# Altium schematic sheet MCU.SchDoc
size A3
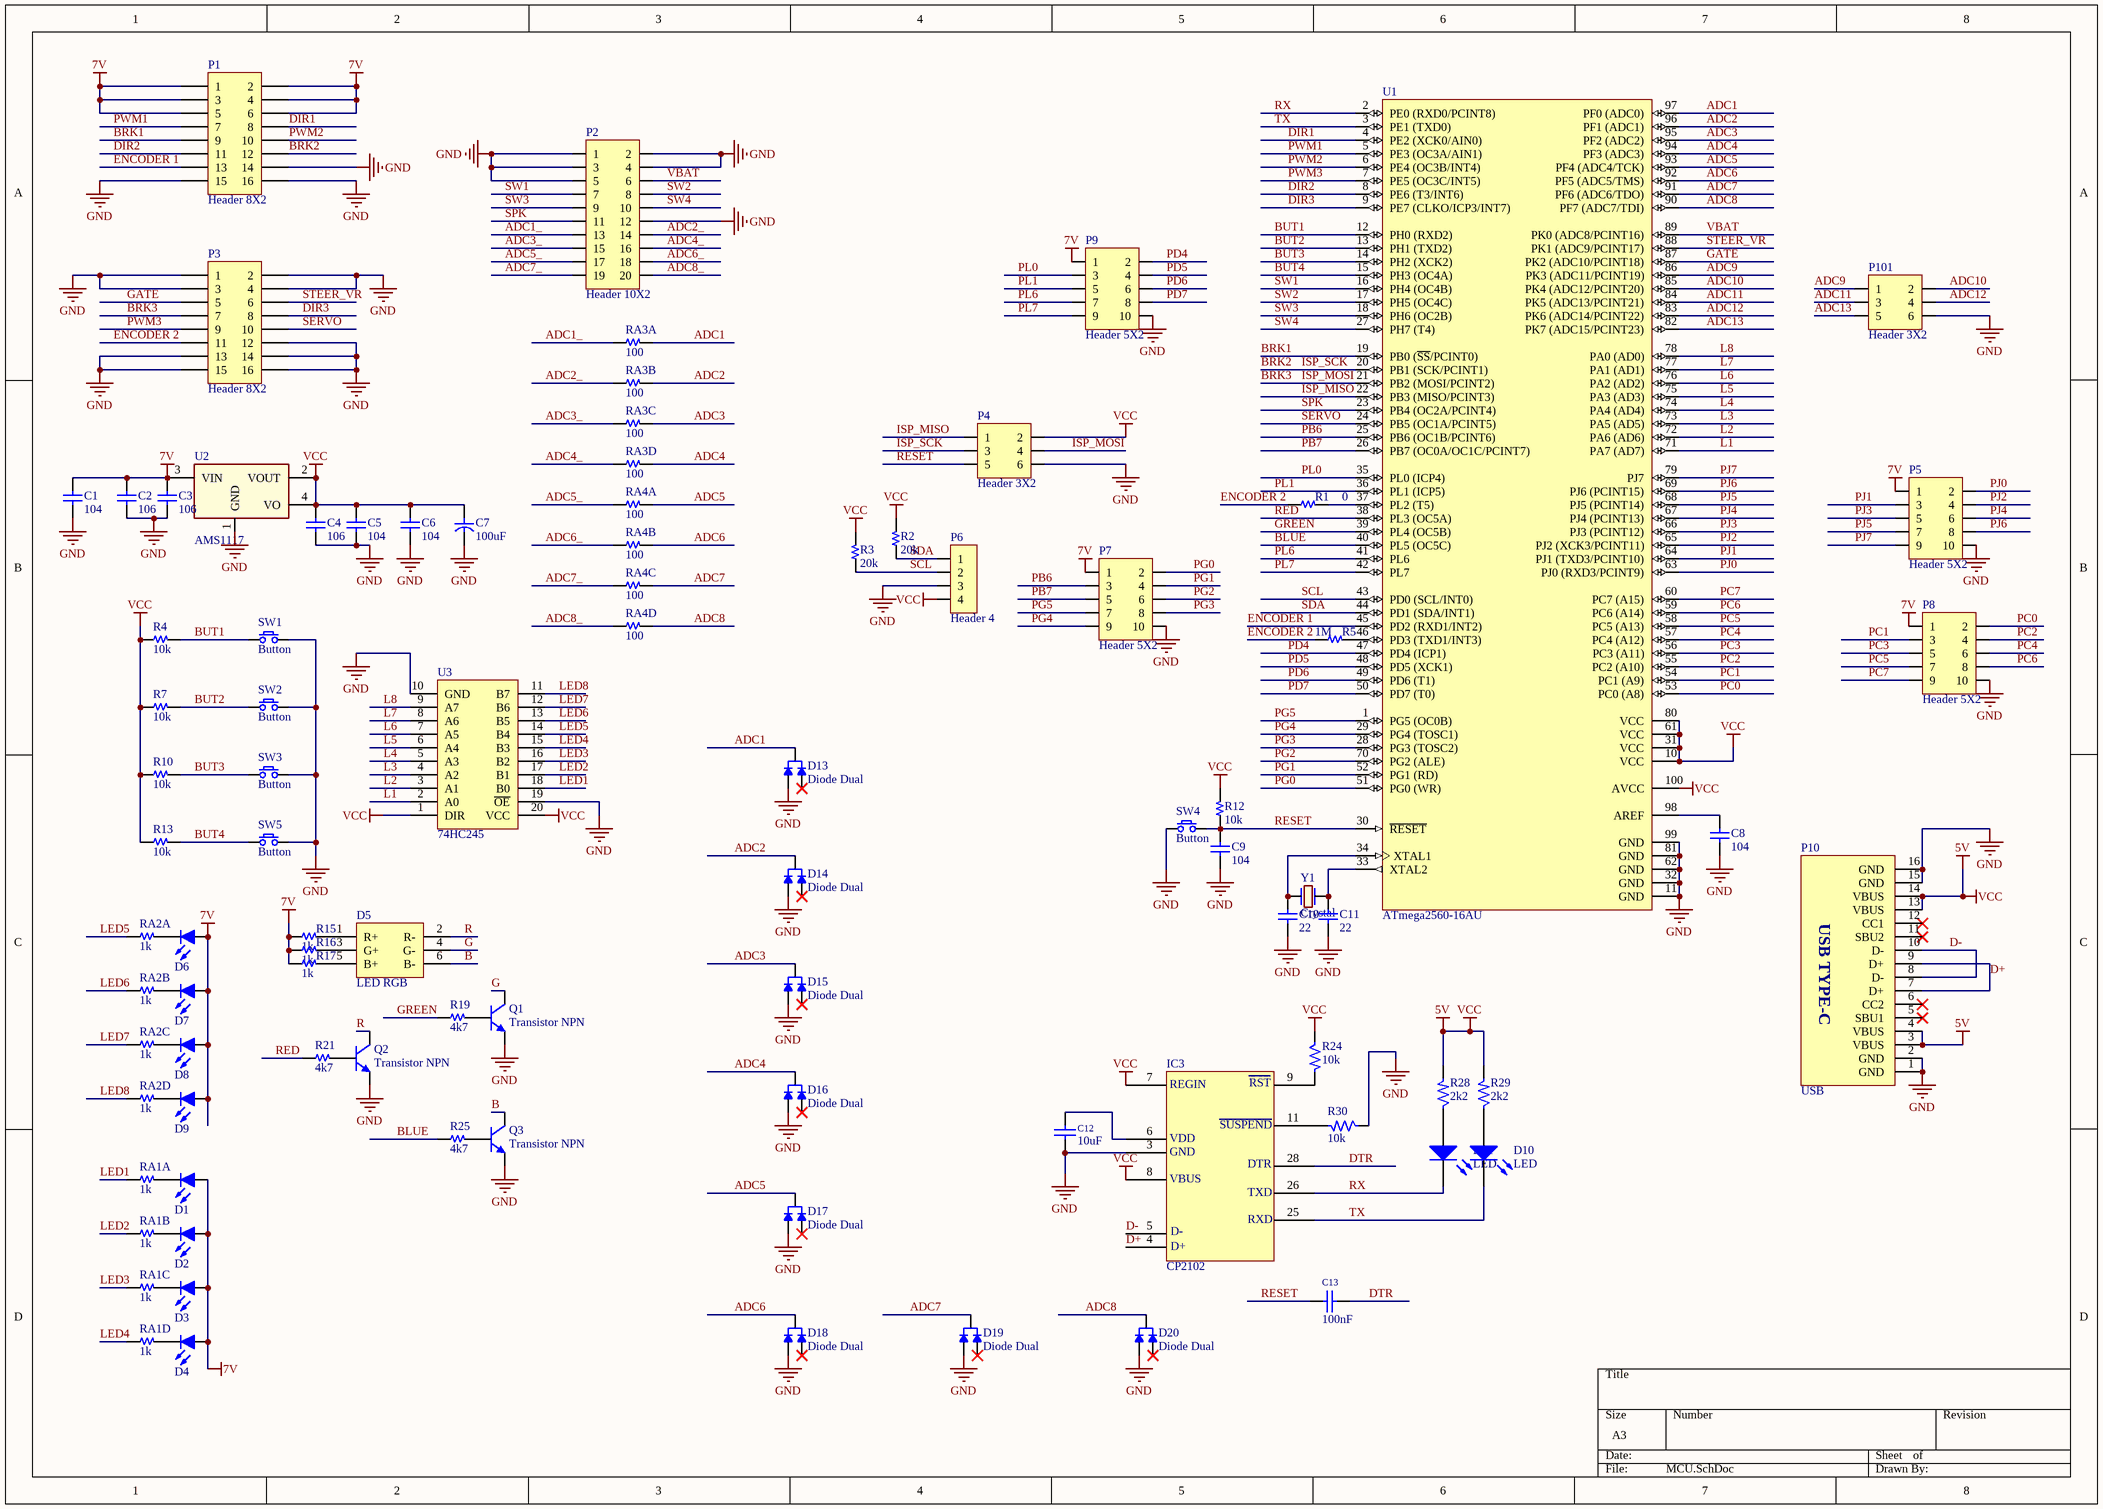
[diagram p0: MCU.SchDoc]

## Parts
C1  104  [C 0805]
C2  106  [C 0805]
C3  106  [C 0805]
C4  106  [C 0805]
C5  104  [C 0805]
C6  104  [C 0805]
C7  100uF  [C SMD TAN 2312 (C)]
C8  104  [C 0805]
C9  104  [C 0805]
C10  22  [C 0805]
C11  22  [C 0805]
C12  10uF  [C 0805]
C13  100nF  [C 0805]
D1  Led  [Led 0805 RED]  (value not drawn)
D2  Led  [Led 0805 RED]  (value not drawn)
D3  Led  [Led 0805 RED]  (value not drawn)
D4  Led  [Led 0805 RED]  (value not drawn)
D5  LED RGB  [LED RGB 5050]
D6  Led  [Led 0805 RED]  (value not drawn)
D7  Led  [Led 0805 RED]  (value not drawn)
D8  Led  [Led 0805 RED]  (value not drawn)
D9  Led  [Led 0805 RED]  (value not drawn)
D10  LED  [Led 0805 RED]
D11  LED  [Led 0805 RED]
D13  Diode Dual  [SOT-23]
D14  Diode Dual  [SOT-23]
D15  Diode Dual  [SOT-23]
D16  Diode Dual  [SOT-23]
D17  Diode Dual  [SOT-23]
D18  Diode Dual  [SOT-23]
D19  Diode Dual  [SOT-23]
D20  Diode Dual  [SOT-23]
IC3  CP2102  [QFN-P28_N]
P1  Header 8X2  [CON2X8N]
P2  Header 10X2  [HDR/Header/20/DL]
P3  Header 8X2  [CON2X8N]
P4  Header 3X2  [HDR/Header/6/DL/BOX]
P5  Header 5X2  [HDR/Header/10/DL]
P6  Header 4  [HDR/Header/4/BOX]
P7  Header 5X2  [HDR/Header/10/DL]
P8  Header 5X2  [HDR/Header/10/DL]
P9  Header 5X2  [HDR/Header/10/DL]
P10  USB  [USB Type C 16P]
P101  Header 3X2  [HDR/Header/6/DL]
Q1  Transistor NPN  [SOT-23]
Q2  Transistor NPN  [SOT-23]
Q3  Transistor NPN  [SOT-23]
R1  0  [R 0805]
R2  20k  [R 0805]
R3  20k  [R 0805]
R4  10k  [R 0805]
R5  1M  [R 0805]
R7  10k  [R 0805]
R10  10k  [R 0805]
R12  10k  [R 0805]
R13  10k  [R 0805]
R15  1k  [R 0805]
R16  1k  [R 0805]
R17  1k  [R 0805]
R19  4k7  [R 0805]
R21  4k7  [R 0805]
R24  10k  [R 0805]
R25  4k7  [R 0805]
R28  2k2  [R 0805]
R29  2k2  [R 0805]
R30  10k  [R 0805]
RA1  1k  [RAx4 1206 (3216)]  (parts A,B,C,D of 4)
RA2  1k  [RAx4 1206 (3216)]  (parts A,B,C,D of 4)
RA3  100  [RAx4 1206 (3216)]  (parts A,B,C,D of 4)
RA4  100  [RAx4 1206 (3216)]  (parts A,B,C,D of 4)
SW1  Button  [SW/2/SMD]
SW2  Button  [SW/2/SMD]
SW3  Button  [SW/2/SMD]
SW4  Button  [SW/2/SMD]
SW5  Button  [SW/2/SMD]
U1  ATmega2560-16AU  [100A_N]
U2  AMS1117  [SOT-223]
U3  74HC245  [SSOP-20]
Y1  Crystal  [Crystal HC49US SMD]

## Nets
5V: C4.1 C5.1 C6.1 C7.1 IC3.7 IC3.8 P4.2 P6.4 P10.3(VBUS) P10.4(VBUS) P10.13(VBUS) P10.14(VBUS) R2.2 R3.2 R4.1 R7.1 R10.1 R12.2 R13.1 R24.1 R28.2 R29.2 U1.10(VCC) U1.31(VCC) U1.61(VCC) U1.80(VCC) U1.100(AVCC) U2.2(VOUT) U2.4(VO) U3.1(DIR) U3.20(VCC)  [also labelled VCC]
7V: C1.1 C2.1 C3.1 D1.1(A) D2.1(A) D3.1(A) D4.1(A) D6.1(A) D7.1(A) D8.1(A) D9.1(A) P1.1 P1.2 P1.3 P1.4 P1.5 P1.6 P5.1 P7.1 P8.1 P9.1 R15.1 R16.1 R17.1 U2.3(VIN)
GND: C1.2 C2.2 C3.2 C4.2 C5.2 C6.2 C7.2 C8.2 C9.2 C10.2 C11.2 C12.1 D13.1(A1) D14.1(A1) D15.1(A1) D16.1(A1) D17.1(A1) D18.1(A1) D19.1(A1) D20.1(A1) IC3.3 P1.14 P1.15 P1.16 P2.1 P2.2 P2.3 P2.4 P2.5 P2.12 P3.1 P3.2 P3.3 P3.4 P3.12 P3.13 P3.14 P3.15 P3.16 P4.6 P5.10 P6.3 P7.10 P8.10 P9.10 P10.1(GND) P10.2(GND) P10.15(GND) P10.16(GND) P101.6 Q1.2(E) Q2.2(E) Q3.2(E) R30.1 SW1.2 SW2.2 SW3.2 SW4.1 SW5.2 U1.11(GND) U1.32(GND) U1.62(GND) U1.81(GND) U1.99(GND) U2.1(GND) U3.10(GND) U3.19(~{OE})
ADC1: D13.3(K) RA3.8 U1.97(PF0_(ADC0))
ADC1_: P2.13 RA3.1
ADC2: D14.3(K) RA3.7 U1.96(PF1_(ADC1))
ADC2_: P2.14 RA3.2
ADC3: D15.3(K) RA3.6 U1.95(PF2_(ADC2))
ADC3_: P2.15 RA3.3
ADC4: D16.3(K) RA3.5 U1.94(PF3_(ADC3))
ADC4_: P2.16 RA3.4
ADC5: D17.3(K) RA4.8 U1.93(PF4_(ADC4/TCK))
ADC5_: P2.17 RA4.1
ADC6: D18.3(K) RA4.7 U1.92(PF5_(ADC5/TMS))
ADC6_: P2.18 RA4.2
ADC7: D19.3(K) RA4.6 U1.91(PF6_(ADC6/TDO))
ADC7_: P2.19 RA4.3
ADC8: D20.3(K) RA4.5 U1.90(PF7_(ADC7/TDI))
ADC8_: P2.20 RA4.4
ADC9: P101.1 U1.86(PK3_(ADC11/PCINT19))
ADC10: P101.2 U1.85(PK4_(ADC12/PCINT20))
ADC11: P101.3 U1.84(PK5_(ADC13/PCINT21))
ADC12: P101.4 U1.83(PK6_(ADC14/PCINT22))
ADC13: P101.5 U1.82(PK7_(ADC15/PCINT23))
B: D5.6(B-) Q3.3(C)
BLUE: R25.1 U1.40(PL5_(OC5C))
BRK1: P1.9 U1.19(PB0_(~{SS}/PCINT0))
BRK2: P1.12 P4.3 U1.20(PB1_(SCK/PCINT1))  [also labelled ISP_SCK]
BRK3: P3.7 P4.4 U1.21(PB2_(MOSI/PCINT2))  [also labelled ISP_MOSI]
BUT1: R4.2 SW1.1 U1.12(PH0_(RXD2))
BUT2: R7.2 SW2.1 U1.13(PH1_(TXD2))
BUT3: R10.2 SW3.1 U1.14(PH2_(XCK2))
BUT4: R13.2 SW5.1 U1.15(PH3_(OC4A))
D+: IC3.4 P10.7(D+) P10.9(D+)
D-: IC3.5 P10.8(D-) P10.10(D-)
DIR1: P1.8 U1.4(PE2_(XCK0/AIN0))
DIR2: P1.11 U1.8(PE6_(T3/INT6))
DIR3: P3.8 U1.9(PE7_(CLKO/ICP3/INT7))
DTR: C13.2 IC3.28
ENCODER 1: P1.13 U1.45(PD2_(RXD1/INT2))
ENCODER 2: P3.11 R1.1 R5.1
G: D5.4(G-) Q1.3(C)
GATE: P3.5 U1.87(PK2_(ADC10/PCINT18))
GREEN: R19.1 U1.39(PL4_(OC5B))
ISP_MISO: P4.1 U1.22(PB3_(MISO/PCINT3))
L1: U1.71(PA7_(AD7)) U3.2(A0)
L2: U1.72(PA6_(AD6)) U3.3(A1)
L3: U1.73(PA5_(AD5)) U3.4(A2)
L4: U1.74(PA4_(AD4)) U3.5(A3)
L5: U1.75(PA3_(AD3)) U3.6(A4)
L6: U1.76(PA2_(AD2)) U3.7(A5)
L7: U1.77(PA1_(AD1)) U3.8(A6)
L8: U1.78(PA0_(AD0)) U3.9(A7)
LED1: RA1.1 U3.18(B0)
LED2: RA1.2 U3.17(B1)
LED3: RA1.3 U3.16(B2)
LED4: RA1.4 U3.15(B3)
LED5: RA2.1 U3.14(B4)
LED6: RA2.2 U3.13(B5)
LED7: RA2.3 U3.12(B6)
LED8: RA2.4 U3.11(B7)
PB6: P7.3 U1.25(PB6_(OC1B/PCINT6))
PB7: P7.5 U1.26(PB7_(OC0A/OC1C/PCINT7))
PC0: P8.2 U1.53(PC0_(A8))
PC1: P8.3 U1.54(PC1_(A9))
PC2: P8.4 U1.55(PC2_(A10))
PC3: P8.5 U1.56(PC3_(A11))
PC4: P8.6 U1.57(PC4_(A12))
PC5: P8.7 U1.58(PC5_(A13))
PC6: P8.8 U1.59(PC6_(A14))
PC7: P8.9 U1.60(PC7_(A15))
PD4: P9.2 U1.47(PD4_(ICP1))
PD5: P9.4 U1.48(PD5_(XCK1))
PD6: P9.6 U1.49(PD6_(T1))
PD7: P9.8 U1.50(PD7_(T0))
PG0: P7.2 U1.51(PG0_(WR))
PG1: P7.4 U1.52(PG1_(RD))
PG2: P7.6 U1.70(PG2_(ALE))
PG3: P7.8 U1.28(PG3_(TOSC2))
PG4: P7.9 U1.29(PG4_(TOSC1))
PG5: P7.7 U1.1(PG5_(OC0B))
PJ0: P5.2 U1.63(PJ0_(RXD3/PCINT9))
PJ1: P5.3 U1.64(PJ1_(TXD3/PCINT10))
PJ2: P5.4 U1.65(PJ2_(XCK3/PCINT11))
PJ3: P5.5 U1.66(PJ3_(PCINT12))
PJ4: P5.6 U1.67(PJ4_(PCINT13))
PJ5: P5.7 U1.68(PJ5_(PCINT14))
PJ6: P5.8 U1.69(PJ6_(PCINT15))
PJ7: P5.9 U1.79(PJ7)
PL0: P9.3 U1.35(PL0_(ICP4))
PL1: P9.5 U1.36(PL1_(ICP5))
PL6: P9.7 U1.41(PL6)
PL7: P9.9 U1.42(PL7)
PWM1: P1.7 U1.5(PE3_(OC3A/AIN1))
PWM2: P1.10 U1.6(PE4_(OC3B/INT4))
PWM3: P3.9 U1.7(PE5_(OC3C/INT5))
R: D5.2(R-) Q2.3(C)
RED: R21.1 U1.38(PL3_(OC5A))
RESET: C9.1 C13.1 P4.5 R12.1 SW4.2 U1.30(~{RESET})
RX: D11.2(K) IC3.26 U1.2(PE0_(RXD0/PCINT8))
SCL: P6.2 R3.1 U1.43(PD0_(SCL/INT0))
SDA: P6.1 R2.1 U1.44(PD1_(SDA/INT1))
SERVO: P3.10 U1.24(PB5_(OC1A/PCINT5))
SPK: P2.11 U1.23(PB4_(OC2A/PCINT4))
STEER_VR: P3.6 U1.88(PK1_(ADC9/PCINT17))
SW1: P2.7 U1.16(PH4_(OC4B))
SW2: P2.8 U1.17(PH5_(OC4C))
SW3: P2.9 U1.18(PH6_(OC2B))
SW4: P2.10 U1.27(PH7_(T4))
TX: D10.2(K) IC3.25 U1.3(PE1_(TXD0))
VBAT: P2.6 U1.89(PK0_(ADC8/PCINT16))
NetC8_1: C8.1 U1.98(AREF)
NetC10_1: C10.1 U1.34(XTAL1) Y1.1
NetC11_1: C11.1 U1.33(XTAL2) Y1.2
NetC12_2: C12.2 IC3.6
NetD1_2: D1.2(K) RA1.8
NetD2_2: D2.2(K) RA1.7
NetD3_2: D3.2(K) RA1.6
NetD4_2: D4.2(K) RA1.5
NetD5_1: D5.1(R+) R15.2
NetD5_3: D5.3(G+) R16.2
NetD5_5: D5.5(B+) R17.2
NetD6_2: D6.2(K) RA2.8
NetD7_2: D7.2(K) RA2.7
NetD8_2: D8.2(K) RA2.6
NetD9_2: D9.2(K) RA2.5
NetD10_1: D10.1(A) R29.1
NetD11_1: D11.1(A) R28.1
NetIC3_9: IC3.9 R24.2
NetIC3_11: IC3.11 R30.2
NetQ1_1: Q1.1(B) R19.2
NetQ2_1: Q2.1(B) R21.2
NetQ3_1: Q3.1(B) R25.2
NetR1_2: R1.2 U1.37(PL2_(T5))
NetR5_2: R5.2 U1.46(PD3_(TXD1/INT3))

Not connected (* = marked no-connect by the designer): D13 2(A2)*; D14 2(A2)*; D15 2(A2)*; D16 2(A2)*; D17 2(A2)*; D18 2(A2)*; D19 2(A2)*; D20 2(A2)*; P10 5(SBU1)* 6(CC2)* 11(SBU2)* 12(CC1)*

## Notes on the sheet
- (in symbol CP2102) REGIN; RST; SUSPEND; VDD; GND; DTR; VBUS; TXD; RXD; D-; D+
- (in symbol USB TYPE C) USB TYPE-C

## Library data of the parts
C1-C6 C8-C11 = Capacitor NP: Capacitor non-pol
C7 = Capacitor: Capacitor pol
C12 C13 = Capacitor: AEMS Code: 2100341; Vendor: Digikey; Volt: 16V; Published: 13-April-2009; Publisher: Hoang Nguyen; ComponentLink1Description: Digikey Part Link; ComponentLink2Description: Open Datasheet; ComponentLink2URL: H:\LIBRARY\LIBRARY.Datasheet\
  C12: Value: 10uF
  C13: Value: 100nF
D1-D4 D6-D9 = Led: Typical LED
D10 D11 = LED: Typical LED; Published: 8-Jun-2000; LatestRevisionDate: 08-Jul-2005; LatestRevisionNote: Mech Layer 1 removed.; PackageReference: LED-1; Publisher: Altium Limited
D13-D20 = Diode Dual: Dual Default Diode
P1 P3 = Header 8X2: Header, 8-Pin, Dual row
P2 = Header 10X2: Header, 10-Pin, Dual row
P4 P101 = Header 3X2: Header, 3-Pin, Dual row
P5 P7-P9 = Header 5X2: Header, 5-Pin, Dual row
P6 = Header 4: Header, 4-Pin
P10 = USB TYPE C
Q1-Q3 = Transistor NPN: NPN Bipolar Transistor
R1-R5 R7 R10 R12 R13 R15-R17 R19 R21 R25 = Resistor
R24 R28-R30 = R: Resistor 1/4W; Value: R1/4W - 1K
RA1-RA4 = Resistor Array x4
SW1-SW5 = SW SPST: Tact switch 2 pin
U1 = ATmega2560-16AU: 8-bit AVR Microcontroller, 4.5-5.5V, 256KB Flash, 4KB EEPROM, 8KB SRAM, 86 GPIO pins, 100-pin TQFP, Industrial Grade (-40°C to 85°C), Pb-Free; Published: 1-Apr-2010; DatasheetVersion: revL, Aug-2007; PackageVersion: revC, Oct-2001; PackageReference: 100A; Publisher: Altium Limited; PackageDescription: 100-Pin Thin Profile Plastic Quad Flat Pack (TQFP), 14 x 14 x 1.0 mm Body, 0.5 mm Pitch; Supplier 1: Digi-Key; Supplier Part Number 1: ATMEGA2560-16AU-ND; Supplier 2: Farnell; Supplier Part Number 2: 1288330; Supplier 3: Farnell; Supplier Part Number 3: 1661740; Supplier 4: Mouser; Supplier Part Number 4: 556-ATMEGA2560-16AU; Code_JEDEC: MS-026-AED; ComponentLink1Description: Manufacturer Link; ComponentLink1URL: http://www.atmel.com/products/avr/default.asp?; ComponentLink2Description: ATmega640/1280/1281/2560/2561 Datasheet; ComponentLink2URL: http://www.atmel.com/dyn/resources/prod_documents/doc2549.pdf; ComponentLink3Description: ATmega640/1280/1281/2560/2561 Summary; ComponentLink3URL: http://www.atmel.com/dyn/resources/prod_documents/2549S.pdf; ComponentLink4Description: Atmel.com Home; ComponentLink4URL: http://www.atmel.com
U2 = AMS1117: 1A LDO Voltage Regulator, ADJ or fixed 1.5/1.8/2.5/2.85/3.3/5V
U3 = 74HC245: Octal bus tranceiver, 3-state